# Altium schematic sheet ClayCounterCircuit.SchDoc: Document Title
size Letter; DrawnBy: Student; Revision: A1; SheetNumber: 1; SheetTotal: 1
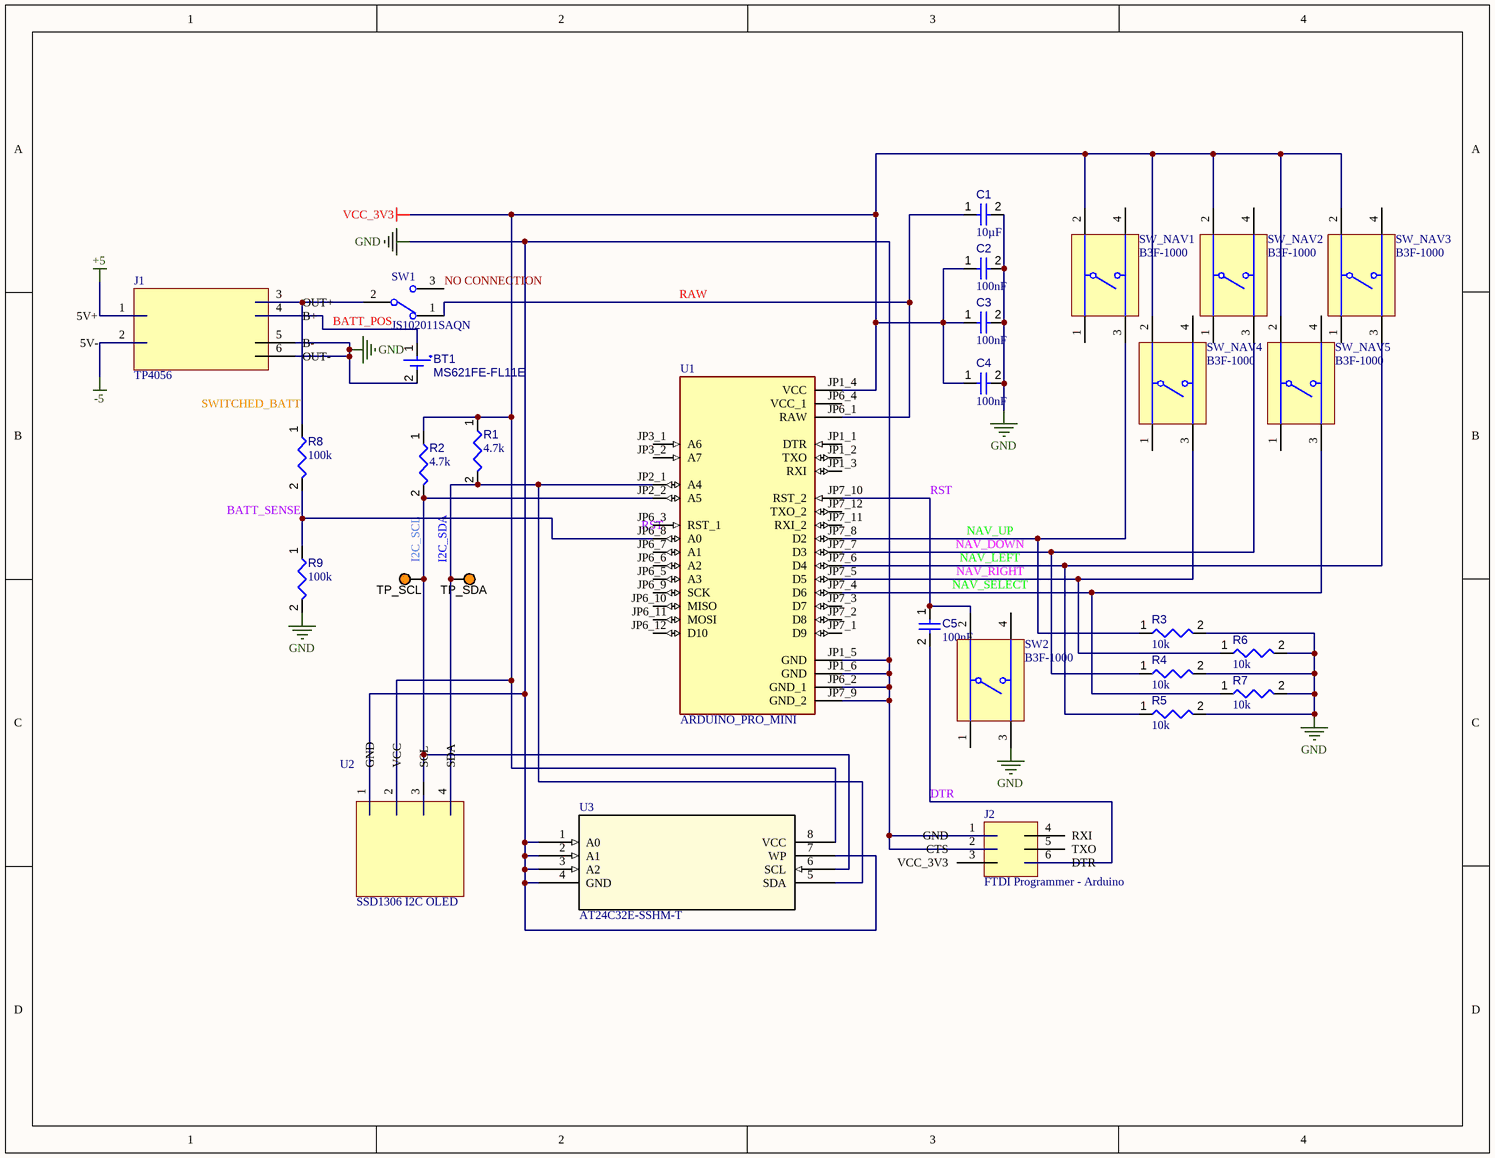
[diagram p0: ClayCounterCircuit.SchDoc]

## Parts
BT1  MS621FE-FL11E  [SEIK-MS621FE-FL11E-2_V]
C1  value 10µF  [CAPC0603(1608)100_L]  (hidden comment: Capacitor 10µF +/-20% 10V 0603)
C2  value 100nF  [CAPC1608X90X40NL10T20]  (hidden comment: Capacitor 100 nF +/-10% 50 V 0603)
C3  value 100nF  [CAPC1608X90X40NL10T20]  (hidden comment: Capacitor 100 nF +/-10% 50 V 0603)
C4  value 100nF  [CAPC1608X90X40NL10T20]  (hidden comment: Capacitor 100 nF +/-10% 50 V 0603)
C5  value 100nF  [CAPC1608X90X40NL10T20]  (hidden comment: Capacitor 100 nF +/-10% 50 V 0603)
J1  TP4056
J2  FTDI Programmer - Arduino
R1  value 4.7k  [RESC1005X40X25ML05T05]  (hidden comment: Resistor 4k7 +/-1% 0402 63 mW)
R2  value 4.7k  [RESC1005X40X25ML05T05]  (hidden comment: Resistor 4k7 +/-1% 0402 63 mW)
R3  value 10k  [RESC1005X40X25ML05T05]  (hidden comment: Resistor 10k +/-1% 0402 63 mW)
R4  value 10k  [RESC1005X40X25ML05T05]  (hidden comment: Resistor 10k +/-1% 0402 63 mW)
R5  value 10k  [RESC1005X40X25ML05T05]  (hidden comment: Resistor 10k +/-1% 0402 63 mW)
R6  value 10k  [RESC1005X40X25ML05T05]  (hidden comment: Resistor 10k +/-1% 0402 63 mW)
R7  value 10k  [RESC1005X40X25ML05T05]  (hidden comment: Resistor 10k +/-1% 0402 63 mW)
R8  value 100k  [RESC1005X40X25ML05T05]  (hidden comment: Resistor 100k +/-1% 0402 63 mW)
R9  value 100k  [RESC1005X40X25ML05T05]  (hidden comment: Resistor 100k +/-1% 0402 63 mW)
SW1  JS102011SAQN  [SW_JS102011SAQN]
SW2  B3F-1000  [OMRON-B3F-1000-4_V]
SW_NAV1  B3F-1000  [OMRON-B3F-1000-4_V]
SW_NAV2  B3F-1000  [OMRON-B3F-1000-4_V]
SW_NAV3  B3F-1000  [OMRON-B3F-1000-4_V]
SW_NAV4  B3F-1000  [OMRON-B3F-1000-4_V]
SW_NAV5  B3F-1000  [OMRON-B3F-1000-4_V]
TP_SCL  5003  [KSTN-5003]  (value not drawn)
TP_SDA  5003  [KSTN-5003]  (value not drawn)
U1  ARDUINO_PRO_MINI  [MODULE_ARDUINO_PRO_MINI]
U2  SSD1306 I2C OLED
U3  AT24C32E-SSHM-T  [8S1_MCH]

## Nets
+5: J1.1(5V+)
-5: J1.2(5V-)
GND: BT1.2(-) C1.2 C2.2 C3.2 C4.2 J2.1(GND) J2.2(CTS) R3.2 R4.2 R5.2 R6.2 R7.2 R9.2 SW2.3 U1.JP1_5(GND) U1.JP1_6(GND) U1.JP6_2(GND_1) U1.JP7_9(GND_2) U2.1(GND) U3.1(A0) U3.2(A1) U3.3(A2) U3.4(GND) U3.7(WP)
VCC_3V3: C2.1 C3.1 C4.1 R1.1 R2.1 SW_NAV1.2 SW_NAV2.2 SW_NAV3.2 SW_NAV4.2 SW_NAV5.2 U1.JP1_4(VCC) U2.2(VCC) U3.8(VCC)
BATT_POS: BT1.1(+) J1.4(B+)
BATT_SENSE: R8.2 R9.1 U1.JP6_8(A0)
DTR: C5.2 J2.6(DTR)
I2C_SCL: R2.2 TP_SCL.1 U1.JP2_2(A5) U3.6(SCL)
I2C_SDA: R1.2 TP_SDA.1 U1.JP2_1(A4) U2.4(SDA) U3.5(SDA)
NAV_DOWN: R4.1 SW_NAV2.3 U1.JP7_7(D3)
NAV_LEFT: R5.1 SW_NAV3.3 U1.JP7_6(D4)
NAV_RIGHT: R6.1 SW_NAV4.3 U1.JP7_5(D5)
NAV_SELECT: R7.1 SW_NAV5.3 U1.JP7_4(D6)
NAV_UP: R3.1 SW_NAV1.3 U1.JP7_8(D2)
NO CONNECTION: SW1.3
RAW: C1.1 SW1.1 U1.JP6_1(RAW)
RST: C5.1 SW2.2 U1.JP6_3(RST_1) U1.JP7_10(RST_2)
SWITCHED_BATT: J1.3(OUT+) R8.1 SW1.2

Not connected (* = marked no-connect by the designer): J1 5(B-) 6(OUT-); J2 3(VCC_3V3) 4(RXI) 5(TXO); SW2 1 4; SW_NAV1 1 4; SW_NAV2 1 4; SW_NAV3 1 4; SW_NAV4 1 4; SW_NAV5 1 4; U1 JP1_1(DTR) JP1_2(TXO) JP1_3(RXI) JP3_1(A6) JP3_2(A7) JP6_4(VCC_1) JP6_5(A3) JP6_6(A2) JP6_7(A1) JP6_9(SCK) JP6_10(MISO) JP6_11(MOSI) JP6_12(D10) JP7_1(D9) JP7_2(D8) JP7_3(D7) JP7_11(RXI_2) JP7_12(TXO_2); U2 3(SCL)

## Notes on the sheet
- Drawn by:
- Date:
- Revision:
- Sheet
- of
- File:
- Size:
- 0.8*Letter
- School of Engineering & Computer Science

## Library data of the parts
BT1 = CMP-00029-00000-1: MS Lihium Rechargeable Battery, 3 V, -20 to 60 degC, Tray; RoHS Compliant: NotApplicable; Mounting Technology: WithLeads; Pins: 2
C1 = CMP-001-00075-4: Chip Capacitor, 10µF +/-20%, 10V, 0603, Thickness 1 mm; Tolerance: 10%; Voltage Rating: 10V; Max Operating Temperature: 85°C; Pins: 2; Case/Package: 0603; Mounting Technology: SMT; Min Operating Temperature: -55°C
C2-C5 = CMP-001-00017-6: Chip Capacitor, 100 nF, +/- 10%, 50 V, 0603 (1608 Metric); Voltage Rating: 50V; Capacitor Type: Ceramic; Tolerance: 10%; Mounting Technology: SM; Max Operating Temperature: 125°C; RoHS Compliant: True; Pins: 2; Case/Package: 0603; Min Operating Temperature: -55°C
J1 = CMP-019-00050-3
J2 = CMP-031-00006-2
R1 R2 = CMP-009-00034-5: Chip Resistor, 4.7 KOhm, +/- 1%, 63 mW, -55 to 155 degC, 0402 (1005 Metric); Power: 63mW; Voltage Rating: 50V; Case/Package: 0402; Tolerance: 1%; Max Operating Temperature: 155°C; Pins: 2; RoHS Compliant: True; Min Operating Temperature: -55°C; Mounting Technology: SM
R3-R7 = CMP-009-00019-5: Chip Resistor, 10 KOhm, +/- 1%, 63 mW, -55 to 155 degC, 0402 (1005 Metric); Power: 63mW; Voltage Rating: 50V; Case/Package: 0402; Mounting Technology: SM; Pins: 2; Min Operating Temperature: -55°C; Tolerance: 1%; RoHS Compliant: True; Max Operating Temperature: 155°C
R8 R9 = CMP-009-00021-5: Chip Resistor, 100 KOhm, +/- 1%, 0.063 W, -55 to 155 degC, 0402 (1005 Metric); Voltage Rating: 50V; Power: 63mW; Pins: 2; Tolerance: 1%; Max Operating Temperature: 155°C; Case/Package: 0402; Min Operating Temperature: -55°C; Mounting Technology: SM; RoHS Compliant: True
SW1 = JS102011SAQN: Slide Switch SPDT Surface Mount, Right Angle; MF: C&K; Check_prices: https://www.snapeda.com/parts/JS102011SAQN/C%2526K/view-part/?ref=eda; Digi-Key_Part_Number: 401-1999-2-ND; Package: None; MP: JS102011SAQN; Value: *; SnapEDA_Link: https://www.snapeda.com/parts/JS102011SAQN/C%2526K/view-part/?ref=snap; Purchase-URL: https://pricing.snapeda.com/search/part/JS102011SAQN/?ref=eda
SW2 SW_NAV1-SW_NAV5 = CMP-011-00004-2: Tactile Switch, SPST-NO, 0.05 A, 24 V, -25 to 70 degC, 4-Pin THD, RoHS, Bulk; Manufacturer: Omron Electronic Components; Throw Configuration: SPST; Max Contact Resistance: 100mohm; Resistance: 0.1Ohm; Max Current Rating: 50mA; Voltage Rating: 24V; Operating Force: 100gf; Datasheet Version: Jan-15; Case/Package: B3F-1000; Packaging: Bulk; Package Description: 4-Pin Through Hole Device, Body 6 x 6 mm; Manufacturer URL: http://www.omron.com/; Package Reference: B3F-1000; Contact Plating: Gold; Contact Current Rating: 50mA; RoHS Compliant: True; Contact Material: Gold; Mounting Technology: TH; Max Operating Temperature: 70°C; Min Operating Temperature: -25°C; Package Quantity: 1500; Datasheet URL: http://www.omron.com/ecb/products/pdf/en-b3f.pdf; Voltage Rating (DC): 24V; Pins: 4; Current Rating: 50mA; Max Voltage Rating (DC): 24V
TP_SCL TP_SDA = CMP-002-00037-2: Test Point, Orange, Height 4.6 mm, Tail Length 3 mm, 1-Pin THD, RoHS; Manufacturer: Keystone; Colour: Orange; Packaging: Bulk; Package Description: 1-Pin Through Hole Device, Dia 2.54 mm; Pins: 1; Package Reference: 5003; Datasheet Version: Jun-15; Case/Package: 5003; Mounting Technology: TH; Connector Type: TestPoint; Diameter: 2.54mm; Contact Material: Bronze; Datasheet URL: http://keyelco.com/userAssets/file/M65p56.pdf; Manufacturer URL: http://www.keyelco.com/; Package Quantity: 10; Contact Plating: Tin; RoHS Compliant: True
U1 = ARDUINO_PRO_MINI: This board was developed for applications and installations where space is premium and projects are made as permanent set ups. Small, available in 3.3 V and 5 V versions, powered by ATmega328P.; MP: Arduino Pro Mini; SnapEDA_Link: https://www.snapeda.com/parts/Arduino%20Pro%20Mini/Arduino/view-part/?ref=snap; Package: None; Value: *; MF: Arduino; Check_prices: https://www.snapeda.com/parts/Arduino%20Pro%20Mini/Arduino/view-part/?ref=eda
U2 = CMP-00000-1
U3 = AT24C32E-SSHM-T: Description; Manufacturer_Name: Microchip; Copyright: Copyright (C) 2025 Ultra Librarian. All rights reserved.; Manufacturer_Part_Number: AT24C32E-SSHM-T; RefDes: RefDes; Type: Type